# Altium project Ezlo_Voice_AssistantHUB.PrjPcb (part 10 of 10)

## Sheet RAM_Sheet.SchDoc
size 420 x 297 mm; DocumentNumber: 24; SheetNumber: 24; SheetTotal: 27
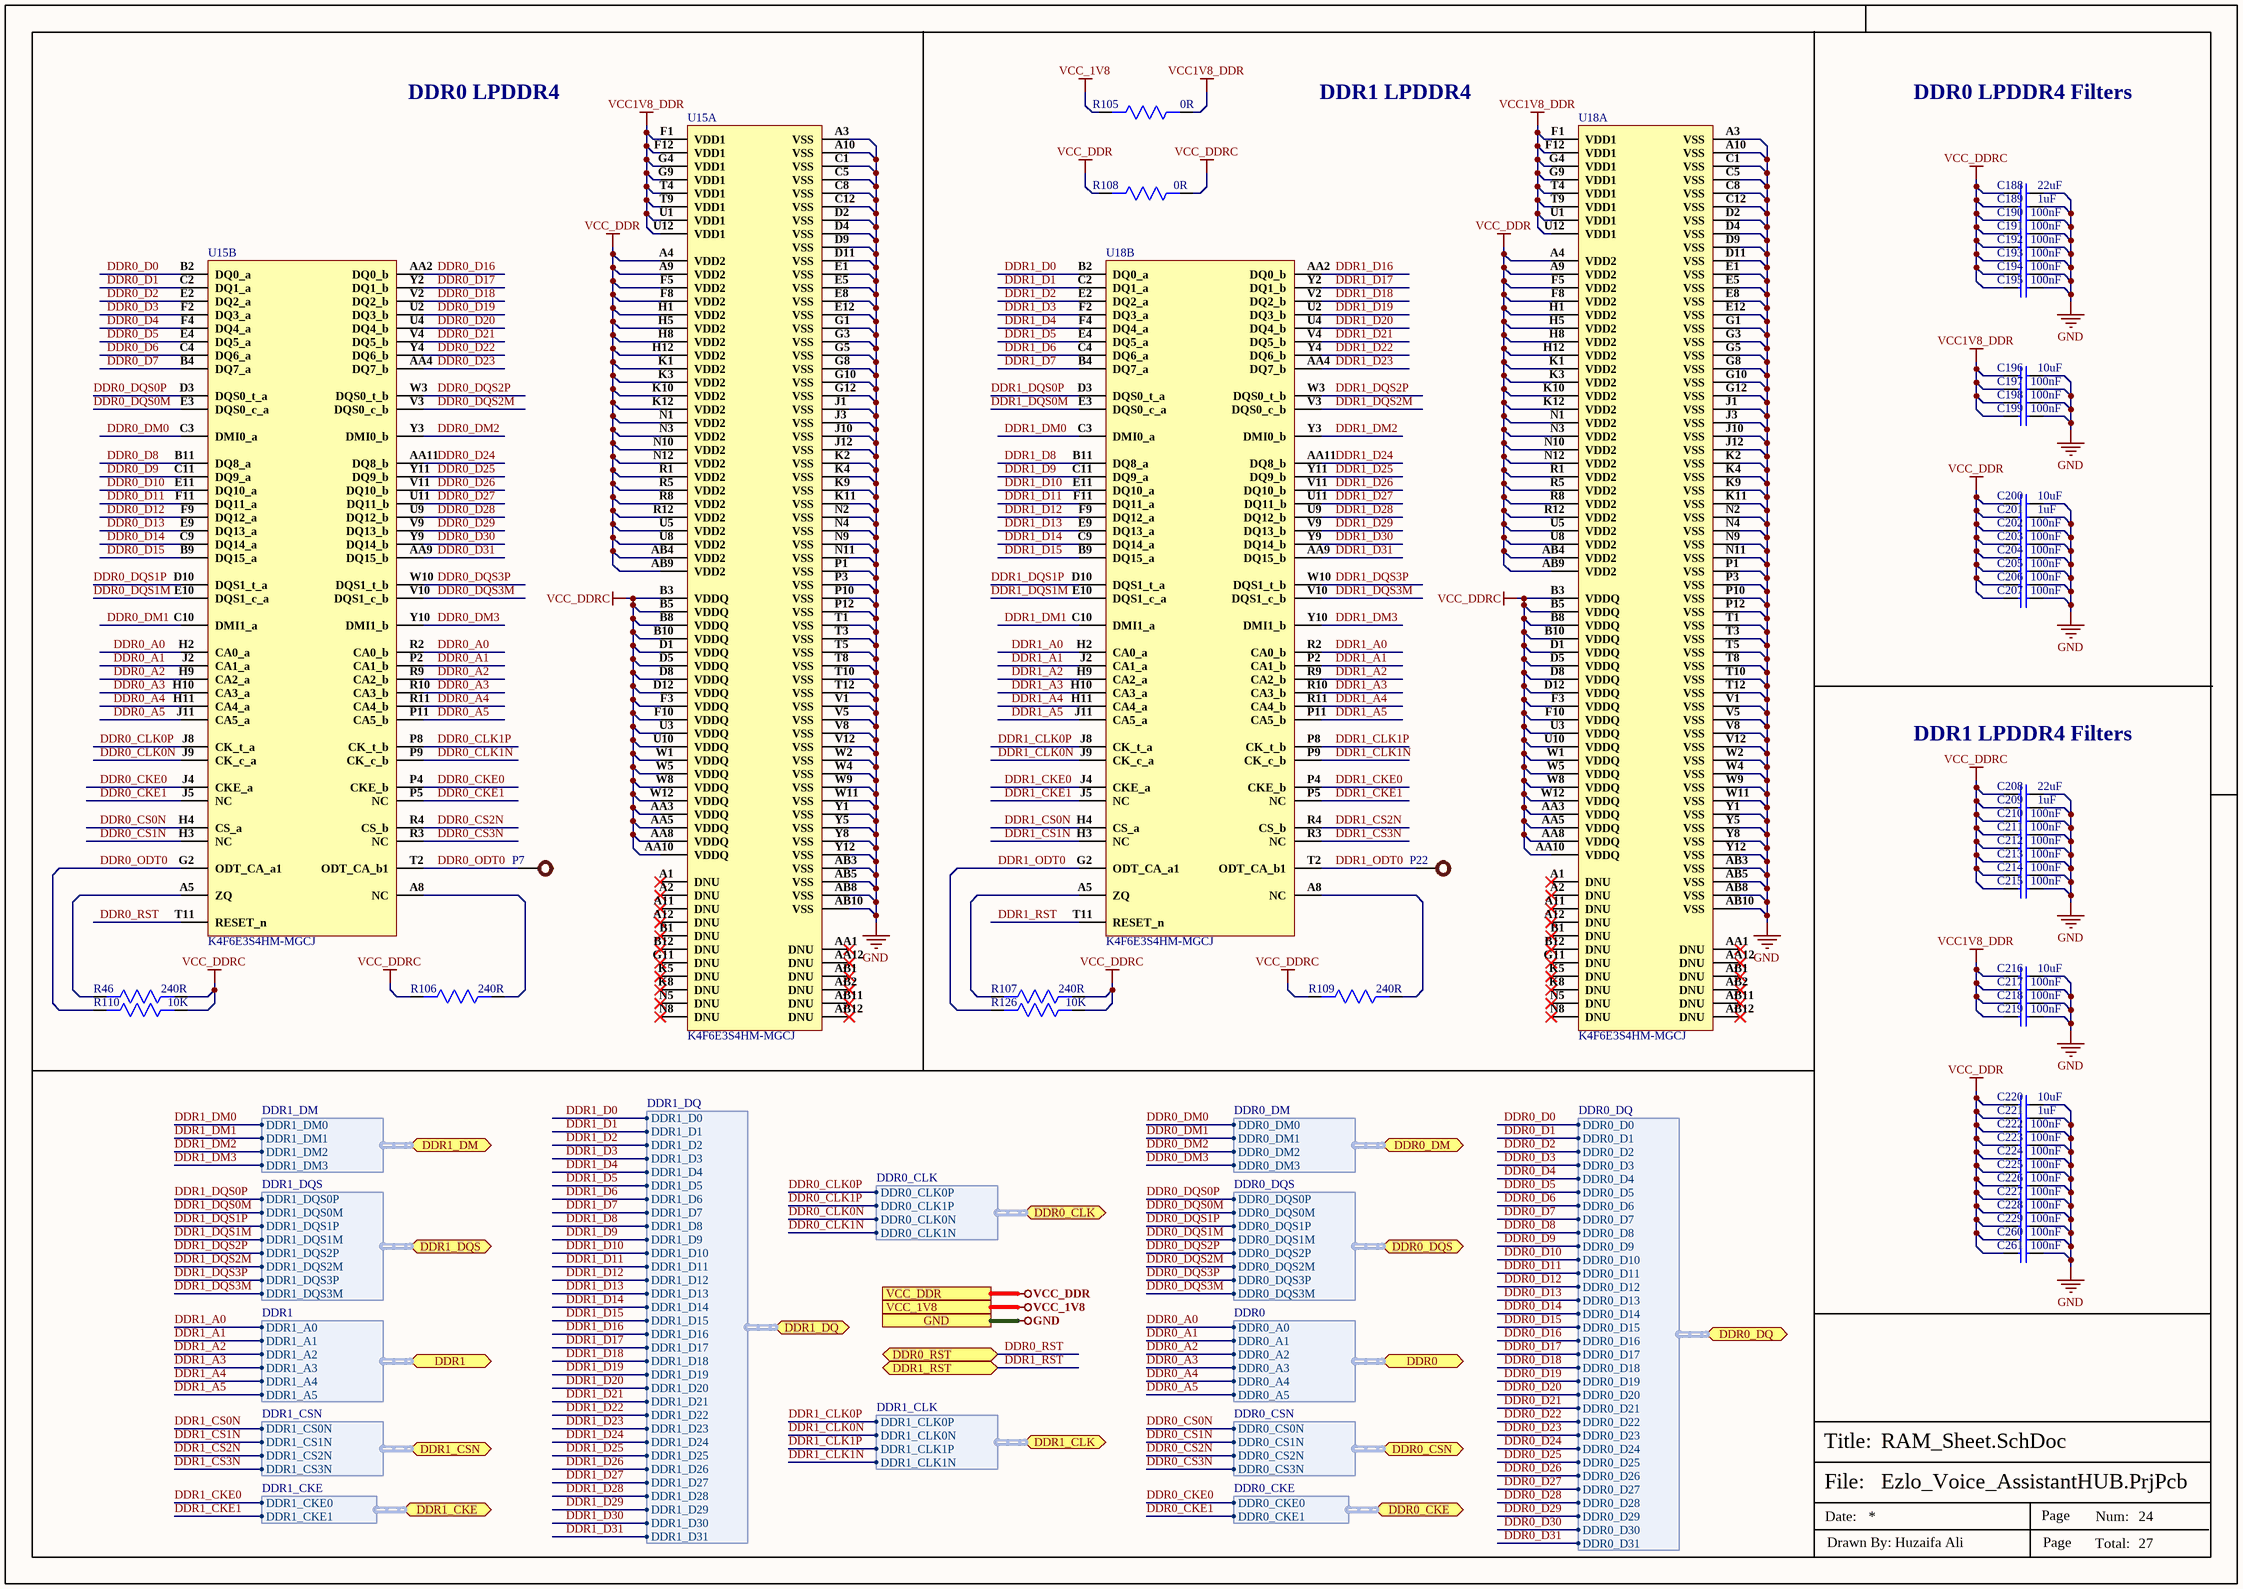
[diagram p25: RAM_Sheet.SchDoc]

### Parts
C188  22uF  [Cap0603]
C189  1uF  [Cap0402]
C190  100nF  [Cap0402]
C191  100nF  [Cap0402]
C192  100nF  [Cap0402]
C193  100nF  [Cap0402]
C194  100nF  [Cap0402]
C195  100nF  [Cap0402]
C196  10uF  [Cap0603]
C197  100nF  [Cap0402]
C198  100nF  [Cap0402]
C199  100nF  [Cap0402]
C200  10uF  [Cap0603]
C201  1uF  [Cap0402]
C202  100nF  [Cap0402]
C203  100nF  [Cap0402]
C204  100nF  [Cap0402]
C205  100nF  [Cap0402]
C206  100nF  [Cap0402]
C207  100nF  [Cap0402]
C208  22uF  [Cap0603]
C209  1uF  [Cap0402]
C210  100nF  [Cap0402]
C211  100nF  [Cap0402]
C212  100nF  [Cap0402]
C213  100nF  [Cap0402]
C214  100nF  [Cap0402]
C215  100nF  [Cap0402]
C216  10uF  [Cap0603]
C217  100nF  [Cap0402]
C218  100nF  [Cap0402]
C219  100nF  [Cap0402]
C220  10uF  [Cap0603]
C221  1uF  [Cap0402]
C222  100nF  [Cap0402]
C223  100nF  [Cap0402]
C224  100nF  [Cap0402]
C225  100nF  [Cap0402]
C226  100nF  [Cap0402]
C227  100nF  [Cap0402]
C228  100nF  [Cap0402]
C229  100nF  [Cap0402]
C260  100nF  [Cap0402]
C261  100nF  [Cap0402]
P7  TEST POINT  [TEST POINT]  (value not drawn)
P22  TEST POINT  [TEST POINT]  (value not drawn)
R46  240R  [Res0402]
R105  0R  [Res0603]
R106  240R  [Res0402]
R107  240R  [Res0402]
R108  0R  [Res0603]
R109  240R  [Res0402]
R110  10K  [Res0402]
R126  10K  [Res0402]
U15  K4F6E3S4HM-MGCJ  [FBGA-200]  (parts A,B of 2)
U18  K4F6E3S4HM-MGCJ  [FBGA-200]  (parts A,B of 2)

### Ports
DDR0 (bidir, harness DDR0), DDR0_CKE (bidir, harness DDR0_CKE), DDR0_CLK (bidir, harness DDR0_CLK), DDR0_CSN (bidir, harness DDR0_CSN), DDR0_DM (bidir, harness DDR0_DM), DDR0_DQ (bidir, harness DDR0_DQ), DDR0_DQS (bidir, harness DDR0_DQS), DDR0_RST (bidir), DDR1 (bidir, harness DDR1), DDR1_CKE (bidir, harness DDR1_CKE), DDR1_CLK (bidir, harness DDR1_CLK), DDR1_CSN (bidir, harness DDR1_CSN), DDR1_DM (bidir, harness DDR1_DM), DDR1_DQ (bidir, harness DDR1_DQ), DDR1_DQS (bidir, harness DDR1_DQS), DDR1_RST (bidir), GND, VCC_1V8, VCC_DDR

### Harnesses
DDR0_DQ: DDR0_D0, DDR0_D1, DDR0_D2, DDR0_D3, DDR0_D4, DDR0_D5, DDR0_D6, DDR0_D7, DDR0_D8, DDR0_D9, DDR0_D10, DDR0_D11, DDR0_D12, DDR0_D13, DDR0_D14, DDR0_D15, DDR0_D16, DDR0_D17, DDR0_D18, DDR0_D19, DDR0_D20, DDR0_D21, DDR0_D22, DDR0_D23, DDR0_D24, DDR0_D25, DDR0_D26, DDR0_D27, DDR0_D28, DDR0_D29, DDR0_D30, DDR0_D31
DDR1_DQ: DDR1_D0, DDR1_D1, DDR1_D2, DDR1_D3, DDR1_D4, DDR1_D5, DDR1_D6, DDR1_D7, DDR1_D8, DDR1_D9, DDR1_D10, DDR1_D11, DDR1_D12, DDR1_D13, DDR1_D14, DDR1_D15, DDR1_D16, DDR1_D17, DDR1_D18, DDR1_D19, DDR1_D20, DDR1_D21, DDR1_D22, DDR1_D23, DDR1_D24, DDR1_D25, DDR1_D26, DDR1_D27, DDR1_D28, DDR1_D29, DDR1_D30, DDR1_D31
DDR0_DM: DDR0_DM0, DDR0_DM1, DDR0_DM2, DDR0_DM3
DDR0_DQS: DDR0_DQS0P, DDR0_DQS0M, DDR0_DQS1P, DDR0_DQS1M, DDR0_DQS2P, DDR0_DQS2M, DDR0_DQS3P, DDR0_DQS3M
DDR0: DDR0_A0, DDR0_A1, DDR0_A2, DDR0_A3, DDR0_A4, DDR0_A5
DDR0_CSN: DDR0_CS0N, DDR0_CS1N, DDR0_CS2N, DDR0_CS3N
DDR0_CKE: DDR0_CKE0, DDR0_CKE1
DDR0_CLK: DDR0_CLK0P, DDR0_CLK1P, DDR0_CLK0N, DDR0_CLK1N
DDR1_CLK: DDR1_CLK0P, DDR1_CLK0N, DDR1_CLK1P, DDR1_CLK1N
DDR1_DM: DDR1_DM0, DDR1_DM1, DDR1_DM2, DDR1_DM3
DDR1_DQS: DDR1_DQS0P, DDR1_DQS0M, DDR1_DQS1P, DDR1_DQS1M, DDR1_DQS2P, DDR1_DQS2M, DDR1_DQS3P, DDR1_DQS3M
DDR1: DDR1_A0, DDR1_A1, DDR1_A2, DDR1_A3, DDR1_A4, DDR1_A5
DDR1_CSN: DDR1_CS0N, DDR1_CS1N, DDR1_CS2N, DDR1_CS3N
DDR1_CKE: DDR1_CKE0, DDR1_CKE1

### Nets
GND: C188.2 C189.2 C190.2 C191.2 C192.2 C193.2 C194.2 C195.2 C196.2 C197.2 C198.2 C199.2 C200.2 C201.2 C202.2 C203.2 C204.2 C205.2 C206.2 C207.2 C208.2 C209.2 C210.2 C211.2 C212.2 C213.2 C214.2 C215.2 C216.2 C217.2 C218.2 C219.2 C220.2 C221.2 C222.2 C223.2 C224.2 C225.2 C226.2 C227.2 C228.2 C229.2 C260.2 C261.2 U15.A3(VSS) U15.A10(VSS) U15.AB3(VSS) U15.AB5(VSS) U15.AB8(VSS) U15.AB10(VSS) U15.C1(VSS) U15.C5(VSS) U15.C8(VSS) U15.C12(VSS) U15.D2(VSS) U15.D4(VSS) U15.D9(VSS) U15.D11(VSS) U15.E1(VSS) U15.E5(VSS) U15.E8(VSS) U15.E12(VSS) U15.G1(VSS) U15.G3(VSS) U15.G5(VSS) U15.G8(VSS) U15.G10(VSS) U15.G12(VSS) U15.J1(VSS) U15.J3(VSS) U15.J10(VSS) U15.J12(VSS) U15.K2(VSS) U15.K4(VSS) U15.K9(VSS) U15.K11(VSS) U15.N2(VSS) U15.N4(VSS) U15.N9(VSS) U15.N11(VSS) U15.P1(VSS) U15.P3(VSS) U15.P10(VSS) U15.P12(VSS) U15.T1(VSS) U15.T3(VSS) U15.T5(VSS) U15.T8(VSS) U15.T10(VSS) U15.T12(VSS) U15.V1(VSS) U15.V5(VSS) U15.V8(VSS) U15.V12(VSS) U15.W2(VSS) U15.W4(VSS) U15.W9(VSS) U15.W11(VSS) U15.Y1(VSS) U15.Y5(VSS) U15.Y8(VSS) U15.Y12(VSS) U18.A3(VSS) U18.A10(VSS) U18.AB3(VSS) U18.AB5(VSS) U18.AB8(VSS) U18.AB10(VSS) U18.C1(VSS) U18.C5(VSS) U18.C8(VSS) U18.C12(VSS) U18.D2(VSS) U18.D4(VSS) U18.D9(VSS) U18.D11(VSS) U18.E1(VSS) U18.E5(VSS) U18.E8(VSS) U18.E12(VSS) U18.G1(VSS) U18.G3(VSS) U18.G5(VSS) U18.G8(VSS) U18.G10(VSS) U18.G12(VSS) U18.J1(VSS) U18.J3(VSS) U18.J10(VSS) U18.J12(VSS) U18.K2(VSS) U18.K4(VSS) U18.K9(VSS) U18.K11(VSS) U18.N2(VSS) U18.N4(VSS) U18.N9(VSS) U18.N11(VSS) U18.P1(VSS) U18.P3(VSS) U18.P10(VSS) U18.P12(VSS) U18.T1(VSS) U18.T3(VSS) U18.T5(VSS) U18.T8(VSS) U18.T10(VSS) U18.T12(VSS) U18.V1(VSS) U18.V5(VSS) U18.V8(VSS) U18.V12(VSS) U18.W2(VSS) U18.W4(VSS) U18.W9(VSS) U18.W11(VSS) U18.Y1(VSS) U18.Y5(VSS) U18.Y8(VSS) U18.Y12(VSS) ; port GND
VCC1V8_DDR: C196.1 C197.1 C198.1 C199.1 C216.1 C217.1 C218.1 C219.1 R105.1 U15.F1(VDD1) U15.F12(VDD1) U15.G4(VDD1) U15.G9(VDD1) U15.T4(VDD1) U15.T9(VDD1) U15.U1(VDD1) U15.U12(VDD1) U18.F1(VDD1) U18.F12(VDD1) U18.G4(VDD1) U18.G9(VDD1) U18.T4(VDD1) U18.T9(VDD1) U18.U1(VDD1) U18.U12(VDD1)
VCC_1V8: R105.2 ; port VCC_1V8
VCC_DDR: C200.1 C201.1 C202.1 C203.1 C204.1 C205.1 C206.1 C207.1 C220.1 C221.1 C222.1 C223.1 C224.1 C225.1 C226.1 C227.1 C228.1 C229.1 C260.1 C261.1 R108.2 U15.A4(VDD2) U15.A9(VDD2) U15.AB4(VDD2) U15.AB9(VDD2) U15.F5(VDD2) U15.F8(VDD2) U15.H1(VDD2) U15.H5(VDD2) U15.H8(VDD2) U15.H12(VDD2) U15.K1(VDD2) U15.K3(VDD2) U15.K10(VDD2) U15.K12(VDD2) U15.N1(VDD2) U15.N3(VDD2) U15.N10(VDD2) U15.N12(VDD2) U15.R1(VDD2) U15.R5(VDD2) U15.R8(VDD2) U15.R12(VDD2) U15.U5(VDD2) U15.U8(VDD2) U18.A4(VDD2) U18.A9(VDD2) U18.AB4(VDD2) U18.AB9(VDD2) U18.F5(VDD2) U18.F8(VDD2) U18.H1(VDD2) U18.H5(VDD2) U18.H8(VDD2) U18.H12(VDD2) U18.K1(VDD2) U18.K3(VDD2) U18.K10(VDD2) U18.K12(VDD2) U18.N1(VDD2) U18.N3(VDD2) U18.N10(VDD2) U18.N12(VDD2) U18.R1(VDD2) U18.R5(VDD2) U18.R8(VDD2) U18.R12(VDD2) U18.U5(VDD2) U18.U8(VDD2) ; port VCC_DDR
VCC_DDRC: C188.1 C189.1 C190.1 C191.1 C192.1 C193.1 C194.1 C195.1 C208.1 C209.1 C210.1 C211.1 C212.1 C213.1 C214.1 C215.1 R46.1 R106.2 R107.1 R108.1 R109.2 R110.1 R126.1 U15.AA3(VDDQ) U15.AA5(VDDQ) U15.AA8(VDDQ) U15.AA10(VDDQ) U15.B3(VDDQ) U15.B5(VDDQ) U15.B8(VDDQ) U15.B10(VDDQ) U15.D1(VDDQ) U15.D5(VDDQ) U15.D8(VDDQ) U15.D12(VDDQ) U15.F3(VDDQ) U15.F10(VDDQ) U15.U3(VDDQ) U15.U10(VDDQ) U15.W1(VDDQ) U15.W5(VDDQ) U15.W8(VDDQ) U15.W12(VDDQ) U18.AA3(VDDQ) U18.AA5(VDDQ) U18.AA8(VDDQ) U18.AA10(VDDQ) U18.B3(VDDQ) U18.B5(VDDQ) U18.B8(VDDQ) U18.B10(VDDQ) U18.D1(VDDQ) U18.D5(VDDQ) U18.D8(VDDQ) U18.D12(VDDQ) U18.F3(VDDQ) U18.F10(VDDQ) U18.U3(VDDQ) U18.U10(VDDQ) U18.W1(VDDQ) U18.W5(VDDQ) U18.W8(VDDQ) U18.W12(VDDQ)
DDR0_A0: U15.H2(CA0_a) U15.R2(CA0_b) ; port DDR0.DDR0_A0  [project net DDR0.DDR0_A0]
DDR0_A1: U15.J2(CA1_a) U15.P2(CA1_b) ; port DDR0.DDR0_A1  [project net DDR0.DDR0_A1]
DDR0_A2: U15.H9(CA2_a) U15.R9(CA2_b) ; port DDR0.DDR0_A2  [project net DDR0.DDR0_A2]
DDR0_A3: U15.H10(CA3_a) U15.R10(CA3_b) ; port DDR0.DDR0_A3  [project net DDR0.DDR0_A3]
DDR0_A4: U15.H11(CA4_a) U15.R11(CA4_b) ; port DDR0.DDR0_A4  [project net DDR0.DDR0_A4]
DDR0_A5: U15.J11(CA5_a) U15.P11(CA5_b) ; port DDR0.DDR0_A5  [project net DDR0.DDR0_A5]
DDR0_CKE0: U15.J4(CKE_a) U15.P4(CKE_b) ; port DDR0_CKE.DDR0_CKE0  [project net DDR0_CKE.DDR0_CKE0]
DDR0_CKE1: U15.J5(NC) U15.P5(NC) ; port DDR0_CKE.DDR0_CKE1  [project net DDR0_CKE.DDR0_CKE1]
DDR0_CLK0N: U15.J9(CK_c_a) ; port DDR0_CLK.DDR0_CLK0N  [project net DDR0_CLK.DDR0_CLK0N]
DDR0_CLK0P: U15.J8(CK_t_a) ; port DDR0_CLK.DDR0_CLK0P  [project net DDR0_CLK.DDR0_CLK0P]
DDR0_CLK1N: U15.P9(CK_c_b) ; port DDR0_CLK.DDR0_CLK1N  [project net DDR0_CLK.DDR0_CLK1N]
DDR0_CLK1P: U15.P8(CK_t_b) ; port DDR0_CLK.DDR0_CLK1P  [project net DDR0_CLK.DDR0_CLK1P]
DDR0_CS0N: U15.H4(CS_a) ; port DDR0_CSN.DDR0_CS0N
DDR0_CS1N: U15.H3(NC) ; port DDR0_CSN.DDR0_CS1N
DDR0_CS2N: U15.R4(CS_b) ; port DDR0_CSN.DDR0_CS2N
DDR0_CS3N: U15.R3(NC) ; port DDR0_CSN.DDR0_CS3N
DDR0_D0: U15.B2(DQ0_a) ; port DDR0_DQ.DDR0_D0
DDR0_D1: U15.C2(DQ1_a) ; port DDR0_DQ.DDR0_D1
DDR0_D2: U15.E2(DQ2_a) ; port DDR0_DQ.DDR0_D2
DDR0_D3: U15.F2(DQ3_a) ; port DDR0_DQ.DDR0_D3
DDR0_D4: U15.F4(DQ4_a) ; port DDR0_DQ.DDR0_D4
DDR0_D5: U15.E4(DQ5_a) ; port DDR0_DQ.DDR0_D5
DDR0_D6: U15.C4(DQ6_a) ; port DDR0_DQ.DDR0_D6
DDR0_D7: U15.B4(DQ7_a) ; port DDR0_DQ.DDR0_D7
DDR0_D8: U15.B11(DQ8_a) ; port DDR0_DQ.DDR0_D8
DDR0_D9: U15.C11(DQ9_a) ; port DDR0_DQ.DDR0_D9
DDR0_D10: U15.E11(DQ10_a) ; port DDR0_DQ.DDR0_D10
DDR0_D11: U15.F11(DQ11_a) ; port DDR0_DQ.DDR0_D11
DDR0_D12: U15.F9(DQ12_a) ; port DDR0_DQ.DDR0_D12
DDR0_D13: U15.E9(DQ13_a) ; port DDR0_DQ.DDR0_D13
DDR0_D14: U15.C9(DQ14_a) ; port DDR0_DQ.DDR0_D14
DDR0_D15: U15.B9(DQ15_a) ; port DDR0_DQ.DDR0_D15
DDR0_D16: U15.AA2(DQ0_b) ; port DDR0_DQ.DDR0_D16
DDR0_D17: U15.Y2(DQ1_b) ; port DDR0_DQ.DDR0_D17
DDR0_D18: U15.V2(DQ2_b) ; port DDR0_DQ.DDR0_D18
DDR0_D19: U15.U2(DQ3_b) ; port DDR0_DQ.DDR0_D19
DDR0_D20: U15.U4(DQ4_b) ; port DDR0_DQ.DDR0_D20
DDR0_D21: U15.V4(DQ5_b) ; port DDR0_DQ.DDR0_D21
DDR0_D22: U15.Y4(DQ6_b) ; port DDR0_DQ.DDR0_D22
DDR0_D23: U15.AA4(DQ7_b) ; port DDR0_DQ.DDR0_D23
DDR0_D24: U15.AA11(DQ8_b) ; port DDR0_DQ.DDR0_D24
DDR0_D25: U15.Y11(DQ9_b) ; port DDR0_DQ.DDR0_D25
DDR0_D26: U15.V11(DQ10_b) ; port DDR0_DQ.DDR0_D26
DDR0_D27: U15.U11(DQ11_b) ; port DDR0_DQ.DDR0_D27
DDR0_D28: U15.U9(DQ12_b) ; port DDR0_DQ.DDR0_D28
DDR0_D29: U15.V9(DQ13_b) ; port DDR0_DQ.DDR0_D29
DDR0_D30: U15.Y9(DQ14_b) ; port DDR0_DQ.DDR0_D30
DDR0_D31: U15.AA9(DQ15_b) ; port DDR0_DQ.DDR0_D31
DDR0_DM0: U15.C3(DMI0_a) ; port DDR0_DM.DDR0_DM0  [project net DDR0_DM.DDR0_DM0]
DDR0_DM1: U15.C10(DMI1_a) ; port DDR0_DM.DDR0_DM1  [project net DDR0_DM.DDR0_DM1]
DDR0_DM2: U15.Y3(DMI0_b) ; port DDR0_DM.DDR0_DM2  [project net DDR0_DM.DDR0_DM2]
DDR0_DM3: U15.Y10(DMI1_b) ; port DDR0_DM.DDR0_DM3  [project net DDR0_DM.DDR0_DM3]
DDR0_DQS0M: U15.E3(DQS0_c_a) ; port DDR0_DQS.DDR0_DQS0M  [project net DDR0_DQS.DDR0_DQS0M]
DDR0_DQS0P: U15.D3(DQS0_t_a) ; port DDR0_DQS.DDR0_DQS0P  [project net DDR0_DQS.DDR0_DQS0P]
DDR0_DQS1M: U15.E10(DQS1_c_a) ; port DDR0_DQS.DDR0_DQS1M  [project net DDR0_DQS.DDR0_DQS1M]
DDR0_DQS1P: U15.D10(DQS1_t_a) ; port DDR0_DQS.DDR0_DQS1P  [project net DDR0_DQS.DDR0_DQS1P]
DDR0_DQS2M: U15.V3(DQS0_c_b) ; port DDR0_DQS.DDR0_DQS2M  [project net DDR0_DQS.DDR0_DQS2M]
DDR0_DQS2P: U15.W3(DQS0_t_b) ; port DDR0_DQS.DDR0_DQS2P  [project net DDR0_DQS.DDR0_DQS2P]
DDR0_DQS3M: U15.V10(DQS1_c_b) ; port DDR0_DQS.DDR0_DQS3M  [project net DDR0_DQS.DDR0_DQS3M]
DDR0_DQS3P: U15.W10(DQS1_t_b) ; port DDR0_DQS.DDR0_DQS3P  [project net DDR0_DQS.DDR0_DQS3P]
DDR0_ODT0: P7.1 R110.2 U15.G2(ODT_CA_a1) U15.T2(ODT_CA_b1)
DDR0_RST: U15.T11(RESET_n) ; port DDR0_RST
DDR1_A0: U18.H2(CA0_a) U18.R2(CA0_b) ; port DDR1.DDR1_A0  [project net DDR1.DDR1_A0]
DDR1_A1: U18.J2(CA1_a) U18.P2(CA1_b) ; port DDR1.DDR1_A1  [project net DDR1.DDR1_A1]
DDR1_A2: U18.H9(CA2_a) U18.R9(CA2_b) ; port DDR1.DDR1_A2  [project net DDR1.DDR1_A2]
DDR1_A3: U18.H10(CA3_a) U18.R10(CA3_b) ; port DDR1.DDR1_A3  [project net DDR1.DDR1_A3]
DDR1_A4: U18.H11(CA4_a) U18.R11(CA4_b) ; port DDR1.DDR1_A4  [project net DDR1.DDR1_A4]
DDR1_A5: U18.J11(CA5_a) U18.P11(CA5_b) ; port DDR1.DDR1_A5  [project net DDR1.DDR1_A5]
DDR1_CKE0: U18.J4(CKE_a) U18.P4(CKE_b) ; port DDR1_CKE.DDR1_CKE0  [project net DDR1_CKE.DDR1_CKE0]
DDR1_CKE1: U18.J5(NC) U18.P5(NC) ; port DDR1_CKE.DDR1_CKE1  [project net DDR1_CKE.DDR1_CKE1]
DDR1_CLK0N: U18.J9(CK_c_a) ; port DDR1_CLK.DDR1_CLK0N  [project net DDR1_CLK.DDR1_CLK0N]
DDR1_CLK0P: U18.J8(CK_t_a) ; port DDR1_CLK.DDR1_CLK0P  [project net DDR1_CLK.DDR1_CLK0P]
DDR1_CLK1N: U18.P9(CK_c_b) ; port DDR1_CLK.DDR1_CLK1N  [project net DDR1_CLK.DDR1_CLK1N]
DDR1_CLK1P: U18.P8(CK_t_b) ; port DDR1_CLK.DDR1_CLK1P  [project net DDR1_CLK.DDR1_CLK1P]
DDR1_CS0N: U18.H4(CS_a) ; port DDR1_CSN.DDR1_CS0N
DDR1_CS1N: U18.H3(NC) ; port DDR1_CSN.DDR1_CS1N
DDR1_CS2N: U18.R4(CS_b) ; port DDR1_CSN.DDR1_CS2N
DDR1_CS3N: U18.R3(NC) ; port DDR1_CSN.DDR1_CS3N
DDR1_D0: U18.B2(DQ0_a) ; port DDR1_DQ.DDR1_D0
DDR1_D1: U18.C2(DQ1_a) ; port DDR1_DQ.DDR1_D1
DDR1_D2: U18.E2(DQ2_a) ; port DDR1_DQ.DDR1_D2
DDR1_D3: U18.F2(DQ3_a) ; port DDR1_DQ.DDR1_D3
DDR1_D4: U18.F4(DQ4_a) ; port DDR1_DQ.DDR1_D4
DDR1_D5: U18.E4(DQ5_a) ; port DDR1_DQ.DDR1_D5
DDR1_D6: U18.C4(DQ6_a) ; port DDR1_DQ.DDR1_D6
DDR1_D7: U18.B4(DQ7_a) ; port DDR1_DQ.DDR1_D7
DDR1_D8: U18.B11(DQ8_a) ; port DDR1_DQ.DDR1_D8
DDR1_D9: U18.C11(DQ9_a) ; port DDR1_DQ.DDR1_D9
DDR1_D10: U18.E11(DQ10_a) ; port DDR1_DQ.DDR1_D10
DDR1_D11: U18.F11(DQ11_a) ; port DDR1_DQ.DDR1_D11
DDR1_D12: U18.F9(DQ12_a) ; port DDR1_DQ.DDR1_D12
DDR1_D13: U18.E9(DQ13_a) ; port DDR1_DQ.DDR1_D13
DDR1_D14: U18.C9(DQ14_a) ; port DDR1_DQ.DDR1_D14
DDR1_D15: U18.B9(DQ15_a) ; port DDR1_DQ.DDR1_D15
DDR1_D16: U18.AA2(DQ0_b) ; port DDR1_DQ.DDR1_D16
DDR1_D17: U18.Y2(DQ1_b) ; port DDR1_DQ.DDR1_D17
DDR1_D18: U18.V2(DQ2_b) ; port DDR1_DQ.DDR1_D18
DDR1_D19: U18.U2(DQ3_b) ; port DDR1_DQ.DDR1_D19
DDR1_D20: U18.U4(DQ4_b) ; port DDR1_DQ.DDR1_D20
DDR1_D21: U18.V4(DQ5_b) ; port DDR1_DQ.DDR1_D21
DDR1_D22: U18.Y4(DQ6_b) ; port DDR1_DQ.DDR1_D22
DDR1_D23: U18.AA4(DQ7_b) ; port DDR1_DQ.DDR1_D23
DDR1_D24: U18.AA11(DQ8_b) ; port DDR1_DQ.DDR1_D24
DDR1_D25: U18.Y11(DQ9_b) ; port DDR1_DQ.DDR1_D25
DDR1_D26: U18.V11(DQ10_b) ; port DDR1_DQ.DDR1_D26
DDR1_D27: U18.U11(DQ11_b) ; port DDR1_DQ.DDR1_D27
DDR1_D28: U18.U9(DQ12_b) ; port DDR1_DQ.DDR1_D28
DDR1_D29: U18.V9(DQ13_b) ; port DDR1_DQ.DDR1_D29
DDR1_D30: U18.Y9(DQ14_b) ; port DDR1_DQ.DDR1_D30
DDR1_D31: U18.AA9(DQ15_b) ; port DDR1_DQ.DDR1_D31
DDR1_DM0: U18.C3(DMI0_a) ; port DDR1_DM.DDR1_DM0  [project net DDR1_DM.DDR1_DM0]
DDR1_DM1: U18.C10(DMI1_a) ; port DDR1_DM.DDR1_DM1  [project net DDR1_DM.DDR1_DM1]
DDR1_DM2: U18.Y3(DMI0_b) ; port DDR1_DM.DDR1_DM2  [project net DDR1_DM.DDR1_DM2]
DDR1_DM3: U18.Y10(DMI1_b) ; port DDR1_DM.DDR1_DM3  [project net DDR1_DM.DDR1_DM3]
DDR1_DQS0M: U18.E3(DQS0_c_a) ; port DDR1_DQS.DDR1_DQS0M  [project net DDR1_DQS.DDR1_DQS0M]
DDR1_DQS0P: U18.D3(DQS0_t_a) ; port DDR1_DQS.DDR1_DQS0P  [project net DDR1_DQS.DDR1_DQS0P]
DDR1_DQS1M: U18.E10(DQS1_c_a) ; port DDR1_DQS.DDR1_DQS1M  [project net DDR1_DQS.DDR1_DQS1M]
DDR1_DQS1P: U18.D10(DQS1_t_a) ; port DDR1_DQS.DDR1_DQS1P  [project net DDR1_DQS.DDR1_DQS1P]
DDR1_DQS2M: U18.V3(DQS0_c_b) ; port DDR1_DQS.DDR1_DQS2M  [project net DDR1_DQS.DDR1_DQS2M]
DDR1_DQS2P: U18.W3(DQS0_t_b) ; port DDR1_DQS.DDR1_DQS2P  [project net DDR1_DQS.DDR1_DQS2P]
DDR1_DQS3M: U18.V10(DQS1_c_b) ; port DDR1_DQS.DDR1_DQS3M  [project net DDR1_DQS.DDR1_DQS3M]
DDR1_DQS3P: U18.W10(DQS1_t_b) ; port DDR1_DQS.DDR1_DQS3P  [project net DDR1_DQS.DDR1_DQS3P]
DDR1_ODT0: P22.1 R126.2 U18.G2(ODT_CA_a1) U18.T2(ODT_CA_b1)
DDR1_RST: U18.T11(RESET_n) ; port DDR1_RST
NetR46_2: R46.2 U15.A5(ZQ)
NetR106_1: R106.1 U15.A8(NC)
NetR107_2: R107.2 U18.A5(ZQ)
NetR109_1: R109.1 U18.A8(NC)

Not connected (* = marked no-connect by the designer): U15 A1(DNU)* A2(DNU)* A11(DNU)* A12(DNU)* AA1(DNU)* AA12(DNU)* AB1(DNU)* AB2(DNU)* AB11(DNU)* AB12(DNU)* B1(DNU)* B12(DNU)* G11(DNU)* K5(DNU)* K8(DNU)* N5(DNU)* N8(DNU)*; U18 A1(DNU)* A2(DNU)* A11(DNU)* A12(DNU)* AA1(DNU)* AA12(DNU)* AB1(DNU)* AB2(DNU)* AB11(DNU)* AB12(DNU)* B1(DNU)* B12(DNU)* G11(DNU)* K5(DNU)* K8(DNU)* N5(DNU)* N8(DNU)*

### Notes on the sheet
- DDR0 LPDDR4
- DDR1 LPDDR4
- DDR0 LPDDR4 Filters
- DDR1 LPDDR4 Filters
- File:
- Title:
- Date:
- Page
- Num:
- Total:
- Drawn By: Huzaifa Ali

### Library data of the parts
C188 C208 = CC0603MRX5R5BB226: CAP CER 22UF 6.3V X5R 0603; Manufacturer: Yageo; Tolerance: 20%; Supplier 1: Mouser; Manufacturer Part Number: CC0603MRX5R5BB226; RoHS: Yes; Category: Ceramic Capacitors; Stock 1: 3030; Pricing 1: 1=0.33000, 10=0.22500, 50=0.22500, 100=0.12800, 1000=0.07900, 10000=0.06500 (USD); Mount: Surface Mount; Case/Package: 0603; Case Code (Metric): 1608; Case Code (Imperial): 0603; Weight: 7.1E-05oz; Min Operating Temperature: -55°C; Max Operating Temperature: 85°C; Capacitance: 22uF; Packaging: Tape and Reel; Dielectric: X5R; Voltage Rating: 6.3V; Termination: SMD/SMT; Resistor Type: Ceramic; Voltage Rating (DC): 6.3V; Package Quantity: 4000; Length: 0.063inch; Width: 0.031inch; Thickness: 0.035inch; Depth: 0.8mm; Lead Free: Lead Free; Halogen Free: Halogen Free; RoHS Compliant: Yes; ComponentLink1URL: http://www.mouser.com/ds/2/447/Yageo_UPY-GP_NP0_16V-to-50V_9-358835.pdf?src-supplier=Mouser; ComponentLink1Description: http://www.mouser.com/ds/2/447/Yageo_UPY-GP_NP0_16V-to-50V_9-358835.pdf?src-supplier=Mouser; ComponentLink2URL: http://www.yageo.com/documents/recent/UPY-GPHC_X5R_4V-to-50V_25.pdf?src-supplier=Digi-Key; ComponentLink2Description: http://www.yageo.com/documents/recent/UPY-GPHC_X5R_4V-to-50V_25.pdf?src-supplier=Digi-Key; Supplier Part Number 1: 603-CC603MRX5R5BB226
C189 C201 C209 C221 = CC0402KRX5R6BB105: CAP CER 1UF 10V X5R 0402; Manufacturer: Yageo; Tolerance: 10%; Dissipation Factor: 15%; Supplier 1: Mouser; Manufacturer Part Number: CC0402KRX5R6BB105; RoHS: Yes; Category: Ceramic Capacitors; Stock 1: 6711367; Pricing 1: 1=0.11000, 10=0.05500, 50=0.05500, 100=0.03300, 500=0.02700, 1000=0.02200, 2500=0.02100, 10000=0.01800 (USD); Mount: Surface Mount; Case/Package: 0402; Number of Pins: 2; Case Code (Metric): 1005; Case Code (Imperial): 0402; Min Operating Temperature: -55°C; Max Operating Temperature: 85°C; Capacitance: 1uF; Dielectric: X5R; Package Quantity: 1; Voltage Rating: 10V; Packaging: Tape and Reel; Voltage Rating (DC): 10V; Termination: SMD/SMT; Resistor Type: Ceramic; Series: CC; Construction: Flat; Length: 1mm; Width: 0.02inch; Height: 0.5mm; Thickness: 0.022inch; Depth: 0.5mm; Radiation Hardening: No; REACH SVHC: No SVHC; Lead Free: Lead Free; Halogen Free: Halogen Free; RoHS Compliant: Yes; ComponentLink1URL: https://datasheet.ciiva.com/176/upy-gphc-x5r-4v-to-50v-12-176704.pdf?src-supplier=Digi-Key; ComponentLink1Description: https://datasheet.ciiva.com/176/upy-gphc-x5r-4v-to-50v-12-176704.pdf?src-supplier=Digi-Key; ComponentLink2URL: https://datasheet.ciiva.com/176/mlccorderingcode-176705.pdf?src-supplier=Digi-Key; ComponentLink2Description: https://datasheet.ciiva.com/176/mlccorderingcode-176705.pdf?src-supplier=Digi-Key; ComponentLink3URL: https://datasheet.ciiva.com/176/mlccorderingcode-176706.pdf?src-supplier=Digi-Key; ComponentLink3Description: https://datasheet.ciiva.com/176/mlccorderingcode-176706.pdf?src-supplier=Digi-Key; Supplier Part Number 1: 603-CC402KRX5R6BB105
C190-C195 C197-C199 C202-C207 C210-C215 C217-C219 C222-C229 C260 C261 = CC0402KRX5R7BB104: CAP CER 0.1UF 16V X5R 0402; Manufacturer: Yageo; Tolerance: 10%; Supplier 1: Mouser; Manufacturer Part Number: CC0402KRX5R7BB104; RoHS: Yes; Category: Ceramic Capacitors; Stock 1: 936792; Pricing 1: 1=0.10000, 10=0.02300, 50=0.02300, 100=0.01100, 1000=0.00600, 10000=0.00400 (USD); Mount: Surface Mount; Case/Package: 0402; Number of Pins: 2; Case Code (Metric): 1005; Case Code (Imperial): 0402; Min Operating Temperature: -55°C; Max Operating Temperature: 85°C; Capacitance: 100nF; Dielectric: X5R; Packaging: Tape and Reel; Voltage Rating: 16V; Package Quantity: 1; Voltage Rating (DC): 16V; Termination: SMD/SMT; Resistor Type: Ceramic; Series: CC; Construction: Flat; Length: 1mm; Width: 0.02inch; Height: 0.5mm; Thickness: 0.022inch; Depth: 0.5mm; Radiation Hardening: No; REACH SVHC: Unknown; Lead Free: Lead Free; Halogen Free: Halogen Free; RoHS Compliant: Yes; ComponentLink1URL: https://datasheet.ciiva.com/155/mlccorderingcode-155879.pdf?src-supplier=Digi-Key; ComponentLink1Description: https://datasheet.ciiva.com/155/mlccorderingcode-155879.pdf?src-supplier=Digi-Key; ComponentLink2URL: https://datasheet.ciiva.com/155/mlccorderingcode-155878.pdf?src-supplier=Digi-Key; ComponentLink2Description: https://datasheet.ciiva.com/155/mlccorderingcode-155878.pdf?src-supplier=Digi-Key; ComponentLink3URL: https://datasheet.ciiva.com/155/mlccorderingcode-155880.pdf?src-supplier=Digi-Key; ComponentLink3Description: https://datasheet.ciiva.com/155/mlccorderingcode-155880.pdf?src-supplier=Digi-Key; ComponentLink4URL: https://datasheet.ciiva.com/11464/upy-gphc-x5r-4v-to-50v-12-11464869.pdf?src-supplier=Avnet; ComponentLink4Description: https://datasheet.ciiva.com/11464/upy-gphc-x5r-4v-to-50v-12-11464869.pdf?src-supplier=Avnet; Supplier Part Number 1: 603-CC402KRX5R7BB104
C196 C200 C216 C220 = CC0603KRX5R6BB106: CAP CER 10UF 10V X5R 0603; Manufacturer: Yageo; Tolerance: 10%; Supplier 1: Digi-Key; Manufacturer Part Number: CC0603KRX5R6BB106; RoHS: Yes; Category: Ceramic Capacitors; Stock 1: 187515; Pricing 1: 1=0.24000, 10=0.16300, 50=0.09780, 100=0.08260, 500=0.05654, 1000=0.05001 (USD); Mount: Surface Mount; Case/Package: 0603; Case Code (Metric): 1608; Case Code (Imperial): 0603; Weight: 7.1E-05oz; Min Operating Temperature: -55°C; Max Operating Temperature: 85°C; Capacitance: 10uF; Packaging: Tape and Reel; Dielectric: X5R; Voltage Rating: 10V; Termination: SMD/SMT; Resistor Type: Ceramic; Voltage Rating (DC): 10V; Package Quantity: 4000; Length: 0.063inch; Width: 0.031inch; Thickness: 0.035inch; Depth: 0.8mm; Lead Free: Lead Free; Halogen Free: Halogen Free; RoHS Compliant: Yes; ComponentLink1URL: http://www.mouser.com/ds/2/447/Yageo_UPY-GP_NP0_16V-to-50V_9-358835.pdf?src-supplier=Mouser; ComponentLink1Description: http://www.mouser.com/ds/2/447/Yageo_UPY-GP_NP0_16V-to-50V_9-358835.pdf?src-supplier=Mouser; ComponentLink2URL: http://www.yageo.com/documents/recent/UPY-GPHC_X5R_4V-to-50V_25.pdf?src-supplier=Digi-Key; ComponentLink2Description: http://www.yageo.com/documents/recent/UPY-GPHC_X5R_4V-to-50V_25.pdf?src-supplier=Digi-Key; Supplier Part Number 1: 311-1782-1-ND
P7 P22 = TEST POINT: Test Point ON
R46 R106 R107 R109 = RC0402FR-07240RL: RES 240 OHM 1% 1/16W 0402; Manufacturer: Yageo; Power Rating: 63mW; Temperature Coefficient: 100ppm/°C; Voltage Rating (DC): 50V; Supplier 1: Mouser; Manufacturer Part Number: RC0402FR-07240RL; RoHS: Yes; Category: Chip SMD Resistors; Stock 1: 1903202; Pricing 1: 1=0.10000, 10=0.01200, 50=0.01200, 100=0.00500, 1000=0.00300, 10000=0.00100 (USD); Case/Package: 0402; Case Code (Metric): 1005; Case Code (Imperial): 0402; Size Code: 0402; Min Operating Temperature: -55°C; Max Operating Temperature: 155°C; Resistance: 240R; Tolerance: 1%; Packaging: Tape and Reel; Resistor Type: Thick Film; Voltage Rating: 50V; Package Quantity: 1; Number of Terminations: 2; Termination: SMD/SMT; Max Power Dissipation: 63mW; Features: Moisture Resistant; Series: RC; Construction: Rectangular; Resistance Tolerance: 1%; Length: 1mm; Width: 0.02inch; Height: 0.016inch; Depth: 0.5mm; REACH SVHC: Unknown; Lead Free: Lead Free; RoHS Compliant: Yes; Military Standard: Not; ComponentLink1URL: https://datasheet.ciiva.com/7849/1018594-7849915.pdf?src-supplier=Element14; ComponentLink1Description: https://datasheet.ciiva.com/7849/1018594-7849915.pdf?src-supplier=Element14; ComponentLink2URL: https://datasheet.ciiva.com/7849/1018594-7849916.pdf?src-supplier=Element14; ComponentLink2Description: https://datasheet.ciiva.com/7849/1018594-7849916.pdf?src-supplier=Element14; ComponentLink3URL: https://datasheet.ciiva.com/2519/pyu-r-int-thick-7-2519157.pdf?src-supplier=Digi-Key; ComponentLink3Description: https://datasheet.ciiva.com/2519/pyu-r-int-thick-7-2519157.pdf?src-supplier=Digi-Key; ComponentLink4URL: https://datasheet.ciiva.com/2519/pyu-r-int-thick-7-2519158.pdf?src-supplier=Digi-Key; ComponentLink4Description: https://datasheet.ciiva.com/2519/pyu-r-int-thick-7-2519158.pdf?src-supplier=Digi-Key; ComponentLink5URL: https://datasheet.ciiva.com/2519/pyu-r-int-thick-7-2519156.pdf?src-supplier=Digi-Key; ComponentLink5Description: https://datasheet.ciiva.com/2519/pyu-r-int-thick-7-2519156.pdf?src-supplier=Digi-Key; ComponentLink6URL: https://datasheet.ciiva.com/12669/pyu-rc0402-51-rohs-l-6-r-12669689.pdf?src-supplier=Mouser; ComponentLink6Description: https://datasheet.ciiva.com/12669/pyu-rc0402-51-rohs-l-6-r-12669689.pdf?src-supplier=Mouser; ComponentLink7URL: https://datasheet.ciiva.com/17419/pyu-rc0402-51-rohs-l-6-r-17419482.pdf?src-supplier=Future+Electronics; ComponentLink7Description: https://datasheet.ciiva.com/17419/pyu-rc0402-51-rohs-l-6-r-17419482.pdf?src-supplier=Future+Electronics; Supplier Part Number 1: 603-RC0402FR-07240RL
R105 R108 = RC0603FR-070RL: RES SMD 0R, 1%, 0.1W, 0603; Manufacturer: Yageo; Resistance: 0mR; Power Rating: 100mW; Voltage Rating (DC): 50V; Temperature Coefficient: 200ppm/°C; Current Rating: 1A; Working Voltage: 75V; Supplier 1: Arrow Electronics; Manufacturer Part Number: RC0603FR-070RL; RoHS: Yes; Category: Chip SMD Resistors; Stock 1: 1270000; Pricing 1: 5000=0.00320, 5000=0.00490, 50000=0.00450, 500000=0.00250, 2500000=0.00150 (USD); Case/Package: 0603; Number of Pins: 2; Contact Plating: Tin,Matte; Case Code (Metric): 1608; Case Code (Imperial): 0603; Min Operating Temperature: -55°C; Max Operating Temperature: 155°C; Resistor Type: Thick Film; Packaging: Tape and Reel; Tolerance: 1%; Package Quantity: 5000; Voltage Rating: 50V; Number of Terminations: 2; Termination: SMD/SMT; Max Power Dissipation: 100mW; Features: Moisture Resistant; Length: 1.6mm; Width: 0.031inch; Height: 0.45mm; Depth: 0.8mm; Radiation Hardening: No; REACH SVHC: No SVHC; Lead Free: Lead Free; Military Standard: Not; ComponentLink1URL: https://datasheet.ciiva.com/11808/0900766b80f96399-11808172.pdf?src-supplier=RSComponents; ComponentLink1Description: https://datasheet.ciiva.com/11808/0900766b80f96399-11808172.pdf?src-supplier=RSComponents; ComponentLink2URL: https://datasheet.ciiva.com/5558/rc0603-272842-5558341.pdf?src-supplier=Mouser; ComponentLink2Description: https://datasheet.ciiva.com/5558/rc0603-272842-5558341.pdf?src-supplier=Mouser; ComponentLink3URL: https://datasheet.ciiva.com/46382/443971-46382072.pdf?src-supplier=Element14; ComponentLink3Description: https://datasheet.ciiva.com/46382/443971-46382072.pdf?src-supplier=Element14; ComponentLink4URL: https://datasheet.ciiva.com/29721/pyu-r-int-thick-7-29721178.pdf?src-supplier=Digi-Key; ComponentLink4Description: https://datasheet.ciiva.com/29721/pyu-r-int-thick-7-29721178.pdf?src-supplier=Digi-Key; ComponentLink5URL: https://datasheet.ciiva.com/5684/443971-5684699.pdf?src-supplier=Farnell; ComponentLink5Description: https://datasheet.ciiva.com/5684/443971-5684699.pdf?src-supplier=Farnell; ComponentLink6URL: https://datasheet.ciiva.com/7983/443971-7983627.pdf?src-supplier=Element14; ComponentLink6Description: https://datasheet.ciiva.com/7983/443971-7983627.pdf?src-supplier=Element14; ComponentLink7URL: https://datasheet.ciiva.com/29721/pyu-rc0603-51-rohs-l-4-29721179.pdf?src-supplier=Digi-Key; ComponentLink7Description: https://datasheet.ciiva.com/29721/pyu-rc0603-51-rohs-l-4-29721179.pdf?src-supplier=Digi-Key; ComponentLink8URL: https://datasheet.ciiva.com/22643/1868787-22643388.pdf?src-supplier=Element14; ComponentLink8Description: https://datasheet.ciiva.com/22643/1868787-22643388.pdf?src-supplier=Element14; Supplier Part Number 1: RC0603FR-070RL
R110 R126 = RC0402FR-0710KL: RES 10K OHM 1% 1/16W 0402; Manufacturer: Yageo; Resistance: 10kR; Voltage Rating (DC): 50V; Temperature Coefficient: 100ppm/°C; Power Rating: 62.5mW; Max Power Dissipation: 63mW; Supplier 1: Mouser; Manufacturer Part Number: RC0402FR-0710KL; RoHS: Yes; Category: Chip SMD Resistors; Stock 1: 18648329; Pricing 1: 1=0.10000, 10=0.01400, 50=0.01400, 100=0.00500, 1000=0.00300, 10000=0.00200 (USD); Case/Package: 0402; Number of Pins: 2; Case Code (Imperial): 0402; Case Code (Metric): 1005; Min Operating Temperature: -55°C; Max Operating Temperature: 155°C; Resistor Type: Thick Film; Tolerance: 1%; Packaging: Tape and Reel; Voltage Rating: 50V; Termination: SMD/SMT; Working Voltage: 50V; Number of Terminations: 2; Features: Moisture Resistant; Series: RC; Resistance Tolerance: 1%; Construction: Rectangular; Length: 1mm; Width: 0.5mm; Height: 0.32mm; Depth: 0.5mm; Lead Pitch: 0.2mm; REACH SVHC: No SVHC; Lead Free: Lead Free; RoHS Compliant: Yes; Military Standard: Not; ComponentLink1URL: https://datasheet.ciiva.com/7660/38568-7660787.pdf?src-supplier=Element14; ComponentLink1Description: https://datasheet.ciiva.com/7660/38568-7660787.pdf?src-supplier=Element14; ComponentLink2URL: https://datasheet.ciiva.com/7849/1686128-7849814.pdf?src-supplier=Element14; ComponentLink2Description: https://datasheet.ciiva.com/7849/1686128-7849814.pdf?src-supplier=Element14; ComponentLink3URL: https://datasheet.ciiva.com/7983/1018594-7983486.pdf?src-supplier=Element14; ComponentLink3Description: https://datasheet.ciiva.com/7983/1018594-7983486.pdf?src-supplier=Element14; ComponentLink4URL: https://datasheet.ciiva.com/22747/1018594-22747512.pdf?src-supplier=Element14; ComponentLink4Description: https://datasheet.ciiva.com/22747/1018594-22747512.pdf?src-supplier=Element14; ComponentLink5URL: https://datasheet.ciiva.com/12667/pyu-rc0402-51-rohs-l-6-r-12667067.pdf?src-supplier=Mouser; ComponentLink5Description: https://datasheet.ciiva.com/12667/pyu-rc0402-51-rohs-l-6-r-12667067.pdf?src-supplier=Mouser; ComponentLink6URL: https://datasheet.ciiva.com/7849/1784430-7849813.pdf?src-supplier=Element14; ComponentLink6Description: https://datasheet.ciiva.com/7849/1784430-7849813.pdf?src-supplier=Element14; ComponentLink7URL: https://datasheet.ciiva.com/7849/1784430-7849815.pdf?src-supplier=Element14; ComponentLink7Description: https://datasheet.ciiva.com/7849/1784430-7849815.pdf?src-supplier=Element14; Supplier Part Number 1: 603-RC0402FR-0710KL
U15 U18 = K4F6E3S4HM-MGCJ: FBGA-200 DDR SDRAM ROHS; Manufacturer: Samsung; Manufacturer Part Number: K4F6E3S4HM-MGCJ; ComponentLink1Description: LCSC; ComponentLink1URL: https://www.lcsc.com/product-detail/DDR-SDRAM_Samsung-K4F6E3S4HM-MGCJ_C2842431.html

## Nets that join several sheets
GND: DSP_Section (23 pins), WiFi_Module_Section (30 pins), Connector_Section (22 pins), Power_Sheet_1 (41 pins), Power_Sheet_3 (52 pins), Power_Sheet_2 (17 pins), Internal_Power_Sheet (67 pins), GND_Sheet (240 pins), CameraOrDisplay_Sheet (6 pins), eMMC_Sheet (5 pins), MIPI_Sheet (R60.1 R61.1), HDMI_Sheet (16 pins), USB_Sheet_2 (30 pins), USB_Sheet (24 pins), MISCIO_Sheet (6 pins), Interface_Sheet (P27.6 R59.2), SDIO_SDMMC_Sheet (13 pins), DDRC_Section (13 pins), DDRC_Sheet_2 (13 pins), Flash_Sheet (22 pins), RAM_Sheet (160 pins)
VBUS_TYPEC0: USB_Sheet_2 (10 pins), USB_Sheet (C157.1)
VCC3V0_SD: Power_Sheet_2 (C29.1 U8.5), SDIO_SDMMC_Sheet (J1.4)
VCC3V3_S3: Power_Sheet_3 (C49.2 C53.1 C54.1 U9.7), Internal_Power_Sheet (U10.J23), USB_Sheet (C153.1 U10.AB18 U10.AB21 U10.Y25), Flash_Sheet (U16.E6 U16.F5 U16.J10 U16.K9)
VCC3V3_S5: Connector_Section (D29.2), Power_Sheet_3 (9 pins), Power_Sheet_2 (C25.1 U7.5)
VCC3V3_SYS: WiFi_Module_Section (C246.1 C247.1 U17.36), Connector_Section (LED2.1 LED3.1 LED4.1 R118.1), Power_Sheet_1 (9 pins), Power_Sheet_3 (14 pins), Power_Sheet_2 (6 pins), HDMI_Sheet (R91.1), USB_Sheet_2 (C162.1 U13.3 U13.4)
VCC_1V5: Power_Sheet_3 (R32.2 U9.2), Internal_Power_Sheet (5 pins)
VCC_1V8: DSP_Section (15 pins), WiFi_Module_Section (C241.1 C242.1 R113.2 U17.34), Power_Sheet_1 (R1.2 R9.2 R12.2), Power_Sheet_3 (7 pins), Internal_Power_Sheet (10 pins), eMMC_Sheet (C146.1 U10.K24), MIPI_Sheet (SB14.2 SB15.2), Flash_Sheet (10 pins), RAM_Sheet (R105.2)
VCC_3V0: Power_Sheet_1 (R8.2), Power_Sheet_3 (7 pins), Internal_Power_Sheet (U10.AC9 U10.K23 U10.P23), CameraOrDisplay_Sheet (R54.2 R55.2), HDMI_Sheet (6 pins), Interface_Sheet (P27.1)
VCC_3V3: WiFi_Module_Section (J8.1), Flash_Sheet (C231.1 C232.1 C233.1 C234.1)
VCC_5V: WiFi_Module_Section (R114.2), Connector_Section (FB1.2 J10.1), Power_Sheet_1 (14 pins), Power_Sheet_3 (15 pins), Power_Sheet_2 (C23.1 R26.2 U7.1), HDMI_Sheet (F1.1 R93.1 R95.1), USB_Sheet_2 (6 pins), USB_Sheet (C158.1 U11.5)
VCC_DDR: Power_Sheet_3 (5 pins), DDRC_Section (23 pins), DDRC_Sheet_2 (23 pins), RAM_Sheet (69 pins)
VCC_EFUSE: Power_Sheet_1 (C3.1 C4.1 U6.5), Power_Sheet_2 (P1.1), MISCIO_Sheet (R65.1 U10.AD23)
VCC_RTC: Connector_Section (D29.3), Power_Sheet_3 (P12.1 R35.1 R36.1 U9.9)
VCC_SDIO: Power_Sheet_3 (U9.12), SDIO_SDMMC_Sheet (U10.T23)
VCCA0V9_HDMI: Power_Sheet_3 (P8.1 U9.5), CameraOrDisplay_Sheet (C142.1 C143.1 U10.AA16 U10.AA17)
VCCA1V8_CODEC: Power_Sheet_3 (U9.31), Internal_Power_Sheet (U10.AA8 U10.Y8)
VCCA1V8_HDMI: Power_Sheet_3 (P9.1 U9.33), CameraOrDisplay_Sheet (C144.1 C145.1 U10.AD16)
VCCA_0V9: Power_Sheet_1 (5 pins), Power_Sheet_2 (P5.1), Internal_Power_Sheet (U10.R17 U10.T24), eMMC_Sheet (C147.1 U10.L24), PCIe_Sheet (SB19.2), USB_Sheet (6 pins), DDRC_Section (C130.1 U10.H14), DDRC_Sheet_2 (C248.1 U10.R8)
VCCA_1V8: Power_Sheet_3 (C62.1 P11.1 U9.3), Power_Sheet_2 (R21.2), Internal_Power_Sheet (U10.P18 U10.R24 U10.U25), PCIe_Sheet (SB20.2), USB_Sheet (C152.1 R74.1 U10.AA18 U10.AA21), MISCIO_Sheet (R66.2), Interface_Sheet (R58.2 U10.AC24)
VDD_CENTER: Power_Sheet_3 (P17.1 R30.1 SB1.1), Internal_Power_Sheet (19 pins)
VDD_CPU_B: Power_Sheet_1 (L1.1 R10.2), Power_Sheet_2 (P2.1), Internal_Power_Sheet (30 pins)
VDD_CPU_L: Power_Sheet_3 (P18.1 R31.1 SB2.1), Internal_Power_Sheet (17 pins)
VDD_GPU: Power_Sheet_1 (L2.1 R11.2), Power_Sheet_2 (P3.1), Internal_Power_Sheet (32 pins)
VDD_LOG: Power_Sheet_1 (5 pins), Power_Sheet_2 (P4.1), Internal_Power_Sheet (21 pins)
BT_HOST_WAKE_L: WiFi_Module_Section (U17.50), SDIO_SDMMC_Sheet (U10.AA25)
BT_REG_ON_H: WiFi_Module_Section (U17.38), MISCIO_Sheet (R66.1 SB18.2), SDIO_SDMMC_Sheet (SB22.2)
BT_WAKE_L: WiFi_Module_Section (U17.49), SDIO_SDMMC_Sheet (U10.AL4)
CHG_CC0_INT_L: CameraOrDisplay_Sheet (U10.R26), USB_Sheet_2 (U13.5)
CPU_B_SLEEP_H: Power_Sheet_1 (U1.A1), Interface_Sheet (U10.N31)
DDR0.DDR0_A0: DDRC_Sheet_2 (U10.F2), RAM_Sheet (U15.H2 U15.R2)
DDR0.DDR0_A1: DDRC_Sheet_2 (U10.F1), RAM_Sheet (U15.J2 U15.P2)
DDR0.DDR0_A2: DDRC_Sheet_2 (U10.G1), RAM_Sheet (U15.H9 U15.R9)
DDR0.DDR0_A3: DDRC_Sheet_2 (U10.G2), RAM_Sheet (U15.H10 U15.R10)
DDR0.DDR0_A4: DDRC_Sheet_2 (U10.H2), RAM_Sheet (U15.H11 U15.R11)
DDR0.DDR0_A5: DDRC_Sheet_2 (U10.H1), RAM_Sheet (U15.J11 U15.P11)
DDR0_CKE.DDR0_CKE0: DDRC_Sheet_2 (U10.E1), RAM_Sheet (U15.J4 U15.P4)
DDR0_CKE.DDR0_CKE1: DDRC_Sheet_2 (U10.F5), RAM_Sheet (U15.J5 U15.P5)
DDR0_CLK.DDR0_CLK0N: DDRC_Sheet_2 (U10.J4), RAM_Sheet (U15.J9)
DDR0_CLK.DDR0_CLK0P: DDRC_Sheet_2 (U10.H4), RAM_Sheet (U15.J8)
DDR0_CLK.DDR0_CLK1N: DDRC_Sheet_2 (U10.J5), RAM_Sheet (U15.P9)
DDR0_CLK.DDR0_CLK1P: DDRC_Sheet_2 (U10.H5), RAM_Sheet (U15.P8)
DDR0_CS0N: DDRC_Sheet_2 (U10.M6), RAM_Sheet (U15.H4)
DDR0_CS1N: DDRC_Sheet_2 (U10.B1), RAM_Sheet (U15.H3)
DDR0_CS2N: DDRC_Sheet_2 (U10.M5), RAM_Sheet (U15.R4)
DDR0_CS3N: DDRC_Sheet_2 (U10.C2), RAM_Sheet (U15.R3)
DDR0_D0: DDRC_Sheet_2 (U10.AB2), RAM_Sheet (U15.B2)
DDR0_D1: DDRC_Sheet_2 (U10.AB1), RAM_Sheet (U15.C2)
DDR0_D2: DDRC_Sheet_2 (U10.AA2), RAM_Sheet (U15.E2)
DDR0_D3: DDRC_Sheet_2 (U10.AA1), RAM_Sheet (U15.F2)
DDR0_D4: DDRC_Sheet_2 (U10.Y2), RAM_Sheet (U15.F4)
DDR0_D5: DDRC_Sheet_2 (U10.Y1), RAM_Sheet (U15.E4)
DDR0_D6: DDRC_Sheet_2 (U10.W1), RAM_Sheet (U15.C4)
DDR0_D7: DDRC_Sheet_2 (U10.W2), RAM_Sheet (U15.B4)
DDR0_D8: DDRC_Sheet_2 (U10.AF2), RAM_Sheet (U15.B11)
DDR0_D9: DDRC_Sheet_2 (U10.AE2), RAM_Sheet (U15.C11)
DDR0_D10: DDRC_Sheet_2 (U10.AF1), RAM_Sheet (U15.E11)
DDR0_D11: DDRC_Sheet_2 (U10.AD2), RAM_Sheet (U15.F11)
DDR0_D12: DDRC_Sheet_2 (U10.AE1), RAM_Sheet (U15.F9)
DDR0_D13: DDRC_Sheet_2 (U10.AD1), RAM_Sheet (U15.E9)
DDR0_D14: DDRC_Sheet_2 (U10.AC1), RAM_Sheet (U15.C9)
DDR0_D15: DDRC_Sheet_2 (U10.AC2), RAM_Sheet (U15.B9)
DDR0_D16: DDRC_Sheet_2 (U10.V1), RAM_Sheet (U15.AA2)
DDR0_D17: DDRC_Sheet_2 (U10.V2), RAM_Sheet (U15.Y2)
DDR0_D18: DDRC_Sheet_2 (U10.U1), RAM_Sheet (U15.V2)
DDR0_D19: DDRC_Sheet_2 (U10.U2), RAM_Sheet (U15.U2)
DDR0_D20: DDRC_Sheet_2 (U10.T1), RAM_Sheet (U15.U4)
DDR0_D21: DDRC_Sheet_2 (U10.T2), RAM_Sheet (U15.V4)
DDR0_D22: DDRC_Sheet_2 (U10.R2), RAM_Sheet (U15.Y4)
DDR0_D23: DDRC_Sheet_2 (U10.R1), RAM_Sheet (U15.AA4)
DDR0_D24: DDRC_Sheet_2 (U10.P1), RAM_Sheet (U15.AA11)
DDR0_D25: DDRC_Sheet_2 (U10.P2), RAM_Sheet (U15.Y11)
DDR0_D26: DDRC_Sheet_2 (U10.N1), RAM_Sheet (U15.V11)
DDR0_D27: DDRC_Sheet_2 (U10.M1), RAM_Sheet (U15.U11)
DDR0_D28: DDRC_Sheet_2 (U10.N2), RAM_Sheet (U15.U9)
DDR0_D29: DDRC_Sheet_2 (U10.L1), RAM_Sheet (U15.V9)
DDR0_D30: DDRC_Sheet_2 (U10.M2), RAM_Sheet (U15.Y9)
DDR0_D31: DDRC_Sheet_2 (U10.L2), RAM_Sheet (U15.AA9)
DDR0_DM.DDR0_DM0: DDRC_Sheet_2 (U10.Y5), RAM_Sheet (U15.C3)
DDR0_DM.DDR0_DM1: DDRC_Sheet_2 (U10.AC5), RAM_Sheet (U15.C10)
DDR0_DM.DDR0_DM2: DDRC_Sheet_2 (U10.U5), RAM_Sheet (U15.Y3)
DDR0_DM.DDR0_DM3: DDRC_Sheet_2 (U10.P5), RAM_Sheet (U15.Y10)
DDR0_DQS.DDR0_DQS0M: DDRC_Sheet_2 (U10.AA4), RAM_Sheet (U15.E3)
DDR0_DQS.DDR0_DQS0P: DDRC_Sheet_2 (U10.Y4), RAM_Sheet (U15.D3)
DDR0_DQS.DDR0_DQS1M: DDRC_Sheet_2 (U10.AD4), RAM_Sheet (U15.E10)
DDR0_DQS.DDR0_DQS1P: DDRC_Sheet_2 (U10.AC4), RAM_Sheet (U15.D10)
DDR0_DQS.DDR0_DQS2M: DDRC_Sheet_2 (U10.V4), RAM_Sheet (U15.V3)
DDR0_DQS.DDR0_DQS2P: DDRC_Sheet_2 (U10.U4), RAM_Sheet (U15.W3)
DDR0_DQS.DDR0_DQS3M: DDRC_Sheet_2 (U10.R4), RAM_Sheet (U15.V10)
DDR0_DQS.DDR0_DQS3P: DDRC_Sheet_2 (U10.P4), RAM_Sheet (U15.W10)
DDR0_RST: DDRC_Sheet_2 (U10.L7), RAM_Sheet (U15.T11)
DDR1.DDR1_A0: DDRC_Section (U10.B10), RAM_Sheet (U18.H2 U18.R2)
DDR1.DDR1_A1: DDRC_Section (U10.A10), RAM_Sheet (U18.J2 U18.P2)
DDR1.DDR1_A2: DDRC_Section (U10.B9), RAM_Sheet (U18.H9 U18.R9)
DDR1.DDR1_A3: DDRC_Section (U10.A9), RAM_Sheet (U18.H10 U18.R10)
DDR1.DDR1_A4: DDRC_Section (U10.B8), RAM_Sheet (U18.H11 U18.R11)
DDR1.DDR1_A5: DDRC_Section (U10.A8), RAM_Sheet (U18.J11 U18.P11)
DDR1_CKE.DDR1_CKE0: DDRC_Section (U10.A5), RAM_Sheet (U18.J4 U18.P4)
DDR1_CKE.DDR1_CKE1: DDRC_Section (U10.E6), RAM_Sheet (U18.J5 U18.P5)
DDR1_CLK.DDR1_CLK0N: DDRC_Section (U10.D8), RAM_Sheet (U18.J9)
DDR1_CLK.DDR1_CLK0P: DDRC_Section (U10.D9), RAM_Sheet (U18.J8)
DDR1_CLK.DDR1_CLK1N: DDRC_Section (U10.E8), RAM_Sheet (U18.P9)
DDR1_CLK.DDR1_CLK1P: DDRC_Section (U10.E9), RAM_Sheet (U18.P8)
DDR1_CS0N: DDRC_Section (U10.F12), RAM_Sheet (U18.H4)
DDR1_CS1N: DDRC_Section (U10.A2), RAM_Sheet (U18.H3)
DDR1_CS2N: DDRC_Section (U10.F11), RAM_Sheet (U18.R4)
DDR1_CS3N: DDRC_Section (U10.B3), RAM_Sheet (U18.R3)
DDR1_D0: DDRC_Section (U10.B15), RAM_Sheet (U18.B2)
DDR1_D1: DDRC_Section (U10.A15), RAM_Sheet (U18.C2)
DDR1_D2: DDRC_Section (U10.B16), RAM_Sheet (U18.E2)
DDR1_D3: DDRC_Section (U10.A16), RAM_Sheet (U18.F2)
DDR1_D4: DDRC_Section (U10.B17), RAM_Sheet (U18.F4)
DDR1_D5: DDRC_Section (U10.A17), RAM_Sheet (U18.E4)
DDR1_D6: DDRC_Section (U10.A18), RAM_Sheet (U18.C4)
DDR1_D7: DDRC_Section (U10.B18), RAM_Sheet (U18.B4)
DDR1_D8: DDRC_Section (U10.B11), RAM_Sheet (U18.B11)
DDR1_D9: DDRC_Section (U10.B12), RAM_Sheet (U18.C11)
DDR1_D10: DDRC_Section (U10.A11), RAM_Sheet (U18.E11)
DDR1_D11: DDRC_Section (U10.B13), RAM_Sheet (U18.F11)
DDR1_D12: DDRC_Section (U10.A12), RAM_Sheet (U18.F9)
DDR1_D13: DDRC_Section (U10.A13), RAM_Sheet (U18.E9)
DDR1_D14: DDRC_Section (U10.A14), RAM_Sheet (U18.C9)
DDR1_D15: DDRC_Section (U10.B14), RAM_Sheet (U18.B9)
DDR1_D16: DDRC_Section (U10.A19), RAM_Sheet (U18.AA2)
DDR1_D17: DDRC_Section (U10.B19), RAM_Sheet (U18.Y2)
DDR1_D18: DDRC_Section (U10.A20), RAM_Sheet (U18.V2)
DDR1_D19: DDRC_Section (U10.B20), RAM_Sheet (U18.U2)
DDR1_D20: DDRC_Section (U10.A21), RAM_Sheet (U18.U4)
DDR1_D21: DDRC_Section (U10.B21), RAM_Sheet (U18.V4)
DDR1_D22: DDRC_Section (U10.B22), RAM_Sheet (U18.Y4)
DDR1_D23: DDRC_Section (U10.A22), RAM_Sheet (U18.AA4)
DDR1_D24: DDRC_Section (U10.A23), RAM_Sheet (U18.AA11)
DDR1_D25: DDRC_Section (U10.B23), RAM_Sheet (U18.Y11)
DDR1_D26: DDRC_Section (U10.A24), RAM_Sheet (U18.V11)
DDR1_D27: DDRC_Section (U10.A25), RAM_Sheet (U18.U11)
DDR1_D28: DDRC_Section (U10.B24), RAM_Sheet (U18.U9)
DDR1_D29: DDRC_Section (U10.A26), RAM_Sheet (U18.V9)
DDR1_D30: DDRC_Section (U10.B25), RAM_Sheet (U18.Y9)
DDR1_D31: DDRC_Section (U10.B26), RAM_Sheet (U18.AA9)
DDR1_DM.DDR1_DM0: DDRC_Section (U10.E17), RAM_Sheet (U18.C3)
DDR1_DM.DDR1_DM1: DDRC_Section (U10.E14), RAM_Sheet (U18.C10)
DDR1_DM.DDR1_DM2: DDRC_Section (U10.E20), RAM_Sheet (U18.Y3)
DDR1_DM.DDR1_DM3: DDRC_Section (U10.E23), RAM_Sheet (U18.Y10)
DDR1_DQS.DDR1_DQS0M: DDRC_Section (U10.D17), RAM_Sheet (U18.E3)
DDR1_DQS.DDR1_DQS0P: DDRC_Section (U10.D18), RAM_Sheet (U18.D3)
DDR1_DQS.DDR1_DQS1M: DDRC_Section (U10.D14), RAM_Sheet (U18.E10)
DDR1_DQS.DDR1_DQS1P: DDRC_Section (U10.D15), RAM_Sheet (U18.D10)
DDR1_DQS.DDR1_DQS2M: DDRC_Section (U10.D20), RAM_Sheet (U18.V3)
DDR1_DQS.DDR1_DQS2P: DDRC_Section (U10.D21), RAM_Sheet (U18.W3)
DDR1_DQS.DDR1_DQS3M: DDRC_Section (U10.D23), RAM_Sheet (U18.V10)
DDR1_DQS.DDR1_DQS3P: DDRC_Section (U10.D24), RAM_Sheet (U18.W10)
DDR1_RST: DDRC_Section (U10.G11), RAM_Sheet (U18.T11)
DIY_LED: Connector_Section (R124.2), MISCIO_Sheet (U10.P24)
DSP_I2S.I2S2_CK: DSP_Section (U14.21), Interface_Sheet (U10.AG3)
DSP_I2S.I2S2_SD: DSP_Section (U14.28), Interface_Sheet (SB12.1 SB13.1)
DSP_I2S.I2S2_WS: DSP_Section (U14.25), Interface_Sheet (SB10.1 SB11.1)
EFUSE_VQPS_EN_H: Power_Sheet_1 (R19.2), MISCIO_Sheet (U10.AK3)
EMMC.EMMC_CLK: eMMC_Sheet (R57.1), Flash_Sheet (U16.M6)
EMMC.EMMC_CMD: eMMC_Sheet (U10.J31), Flash_Sheet (U16.M5)
EMMC.EMMC_D0: eMMC_Sheet (U10.J28), Flash_Sheet (U16.A3)
EMMC.EMMC_D1: eMMC_Sheet (U10.J29), Flash_Sheet (U16.A4)
EMMC.EMMC_D2: eMMC_Sheet (U10.J30), Flash_Sheet (U16.A5)
EMMC.EMMC_D3: eMMC_Sheet (U10.J25), Flash_Sheet (U16.B2)
EMMC.EMMC_D4: eMMC_Sheet (U10.J26), Flash_Sheet (U16.B3)
EMMC.EMMC_D5: eMMC_Sheet (U10.J27), Flash_Sheet (U16.B4)
EMMC.EMMC_D6: eMMC_Sheet (U10.L31), Flash_Sheet (U16.B5)
EMMC.EMMC_D7: eMMC_Sheet (U10.K30), Flash_Sheet (SW7.2 U16.B6)
EMMC.EMMC_STRB: eMMC_Sheet (U10.K31), Flash_Sheet (U16.H5)
EXT_EN: Power_Sheet_1 (R13.2), Power_Sheet_3 (U9.55)
FAN_CTL: Connector_Section (R117.2), CameraOrDisplay_Sheet (U10.T31)
GPIO0_A1: WiFi_Module_Section (R115.2), MISCIO_Sheet (U10.R29)
GPIO2_A7/I2C7_SDA: CameraOrDisplay_Sheet (R54.1 U10.G30), USB_Sheet_2 (SB25.2)
GPIO2_B0/I2C7_SCL: CameraOrDisplay_Sheet (R55.1 U10.H28), USB_Sheet_2 (SB26.2)
GPU_SLEEP_H: Power_Sheet_1 (U2.A1), Interface_Sheet (U10.M25)
HDMI_CEC: eMMC_Sheet (U10.AD7), HDMI_Sheet (Q3.2 R90.1)
HDMI_OUT.HDMI_TX0_N: CameraOrDisplay_Sheet (U10.AL17), HDMI_Sheet (D28.2 D28.9 J5.9)
HDMI_OUT.HDMI_TX0_P: CameraOrDisplay_Sheet (U10.AK17), HDMI_Sheet (D28.1 D28.10 J5.7)
HDMI_OUT.HDMI_TX1_N: CameraOrDisplay_Sheet (U10.AL18), HDMI_Sheet (D27.5 D27.6 J5.6)
HDMI_OUT.HDMI_TX1_P: CameraOrDisplay_Sheet (U10.AK18), HDMI_Sheet (D27.4 D27.7 J5.4)
HDMI_OUT.HDMI_TX2_N: CameraOrDisplay_Sheet (U10.AL19), HDMI_Sheet (D27.2 D27.9 J5.3)
HDMI_OUT.HDMI_TX2_P: CameraOrDisplay_Sheet (U10.AK19), HDMI_Sheet (D27.1 D27.10 J5.1)
HDMI_OUT.HDMI_TXC_N: CameraOrDisplay_Sheet (U10.AL16), HDMI_Sheet (D28.5 D28.6 J5.12)
HDMI_OUT.HDMI_TXC_P: CameraOrDisplay_Sheet (U10.AK16), HDMI_Sheet (D28.4 D28.7 J5.10)
HDMI_OUT.PORT_HPD: CameraOrDisplay_Sheet (D8.2 R53.2), HDMI_Sheet (D25.5 D25.6 J5.19)
I2C0_SCL_PMIC: Power_Sheet_1 (U1.A3 U2.A3), Power_Sheet_3 (R43.2 U9.19), Interface_Sheet (U10.N30)
I2C0_SDA_PMIC: Power_Sheet_1 (U1.B1 U2.B1), Power_Sheet_3 (R41.2 U9.18), Interface_Sheet (U10.M26)
I2C3_HDMI.I2C3_SCL_HDMI: HDMI_Sheet (Q5.2 R94.1), Interface_Sheet (U10.AG6)
I2C3_HDMI.I2C3_SDA_HDMI: HDMI_Sheet (Q4.2 R92.1), Interface_Sheet (U10.AL2)
I2C8.I2C8_SCL: USB_Sheet_2 (SB27.2), Interface_Sheet (SB7.1)
I2C8.I2C8_SDA: USB_Sheet_2 (SB24.2), Interface_Sheet (U10.M29)
LOG_DVS_PWM: Power_Sheet_1 (R7.1 R8.1), Interface_Sheet (U10.M28)
OTP_OUT_H: Power_Sheet_2 (D3.2), Interface_Sheet (U10.P26)
PMIC_INT_L: Power_Sheet_3 (U9.49), MISCIO_Sheet (SB17.2), Interface_Sheet (SB6.1)
PMIC_SLEEP_H: Power_Sheet_3 (U9.50), MISCIO_Sheet (U10.R30)
POWER_ON: Power_Sheet_3 (C44.1 R39.1 U9.51), Power_Sheet_2 (R20.2)
PWR_KEY_L: Power_Sheet_2 (D1.2), eMMC_Sheet (U10.V27)
RECOVER: Power_Sheet_2 (C26.2 R21.1 R23.2), Interface_Sheet (U10.AH26)
RESET_L: Power_Sheet_3 (R40.2 U9.20), Power_Sheet_2 (D5.2 SW4.1), MISCIO_Sheet (C150.1 U10.T30)
RTC_CLKO_SOC: Power_Sheet_3 (R44.1 U9.68), MISCIO_Sheet (R62.2)
RTC_CLKO_WIFI: WiFi_Module_Section (U17.31), Power_Sheet_3 (R42.1 U9.67)
SDI0_WiFi.SDIO0_CLK: WiFi_Module_Section (J8.6 U17.18), SDIO_SDMMC_Sheet (U10.AF7)
SDI0_WiFi.SDIO0_CMD: WiFi_Module_Section (U17.17), SDIO_SDMMC_Sheet (U10.AH6)
SDI0_WiFi.SDIO0_D0: WiFi_Module_Section (J8.2 U17.21), SDIO_SDMMC_Sheet (U10.AD8)
SDI0_WiFi.SDIO0_D1: WiFi_Module_Section (J8.3 U17.22), SDIO_SDMMC_Sheet (U10.AK5)
SDI0_WiFi.SDIO0_D2: WiFi_Module_Section (J8.4 U17.20), SDIO_SDMMC_Sheet (U10.AG7)
SDI0_WiFi.SDIO0_D3: WiFi_Module_Section (J8.5 U17.19), SDIO_SDMMC_Sheet (U10.AE8)
SDI0_WiFi.WIFI_HOST_WAKE_L: WiFi_Module_Section (U17.16), SDIO_SDMMC_Sheet (U10.V31)
SDMMC0_PWR: Power_Sheet_2 (R27.1 U8.3), MISCIO_Sheet (U10.AG4)
STM_I2C.STM_SCL: DSP_Section (R96.2 U14.16), Interface_Sheet (U10.AG1)
STM_I2C.STM_SDA: DSP_Section (R97.2 U14.17), Interface_Sheet (U10.Y6)
TYPEC0_D_N: USB_Sheet_2 (D18.1 D18.10 J4.A7 J4.B7), USB_Sheet (U10.AH23)
TYPEC0_D_P: USB_Sheet_2 (D18.2 D18.9 J4.A6 J4.B6), USB_Sheet (U10.AG23)
TYPEC0_RX1_N: USB_Sheet_2 (D19.5 D19.6 J4.B10), USB_Sheet (U10.AL21)
TYPEC0_RX1_P: USB_Sheet_2 (D19.4 D19.7 J4.B11), USB_Sheet (U10.AK21)
TYPEC0_RX2_N: USB_Sheet_2 (D20.1 D20.10 J4.A10), USB_Sheet (U10.AL23)
TYPEC0_RX2_P: USB_Sheet_2 (D20.2 D20.9 J4.A11), USB_Sheet (U10.AK23)
TYPEC0_SBU1: USB_Sheet_2 (C167.1), USB_Sheet (U10.AK20)
TYPEC0_SBU1_DC: USB_Sheet_2 (R86.1), USB_Sheet (U10.AH17)
TYPEC0_SBU2: USB_Sheet_2 (C168.1), USB_Sheet (U10.AL20)
TYPEC0_SBU2_DC: USB_Sheet_2 (R87.1), USB_Sheet (U10.AG17)
TYPEC0_TX1_N: USB_Sheet_2 (C169.1), USB_Sheet (U10.AK22)
TYPEC0_TX1_P: USB_Sheet_2 (C170.1), USB_Sheet (U10.AL22)
TYPEC0_TX2_N: USB_Sheet_2 (C171.1), USB_Sheet (U10.AK24)
TYPEC0_TX2_P: USB_Sheet_2 (C172.1), USB_Sheet (U10.AL24)
TYPEC0_U2VBUSDET: USB_Sheet_2 (D22.2 R85.1), USB_Sheet (U10.AK30)
UART0.UART0_CTS: WiFi_Module_Section (U17.42), Interface_Sheet (U10.AG8)
UART0.UART0_RTS: WiFi_Module_Section (U17.43), Interface_Sheet (U10.AL5)
UART0.UART0_RXD: WiFi_Module_Section (P39.1 U17.40), Interface_Sheet (U10.AE9)
UART0.UART0_TXD: WiFi_Module_Section (P39.2 U17.41), Interface_Sheet (U10.AH8)
UART2DBG.UART2DBG_RX: Connector_Section (D34.2 R118.2), Interface_Sheet (U10.AK2)
UART2DBG.UART2DBG_TX: Connector_Section (D31.2 R116.2), Interface_Sheet (U10.AJ4)
USBA_N: DSP_Section (U14.32), Connector_Section (J9.2)
USBA_P: DSP_Section (U14.33), Connector_Section (J9.3)
VCC5V0_HOST_EN: CameraOrDisplay_Sheet (U10.R25), USB_Sheet (R79.2)
VCC5V0_TYPEC0_EN: USB_Sheet_2 (R83.2), MISCIO_Sheet (U10.M24)
VDD_CPU_B_FB: Power_Sheet_1 (R10.1 U1.A4), Internal_Power_Sheet (U10.N18)
VDD_GPU_FB: Power_Sheet_1 (R11.1 U2.A4), Internal_Power_Sheet (U10.T15)
VPP_OTP: Power_Sheet_3 (C46.1 R38.2 U9.6), Power_Sheet_2 (Q1.3 SW1.2)
WIFI_REG_ON_H: WiFi_Module_Section (U17.15), MISCIO_Sheet (SB16.2), SDIO_SDMMC_Sheet (SB23.2)
WORK_LED: Connector_Section (R123.2), Interface_Sheet (SB5.1), SDIO_SDMMC_Sheet (SB21.2)
YELLOW_LED: Connector_Section (R125.2), MISCIO_Sheet (U10.N24)